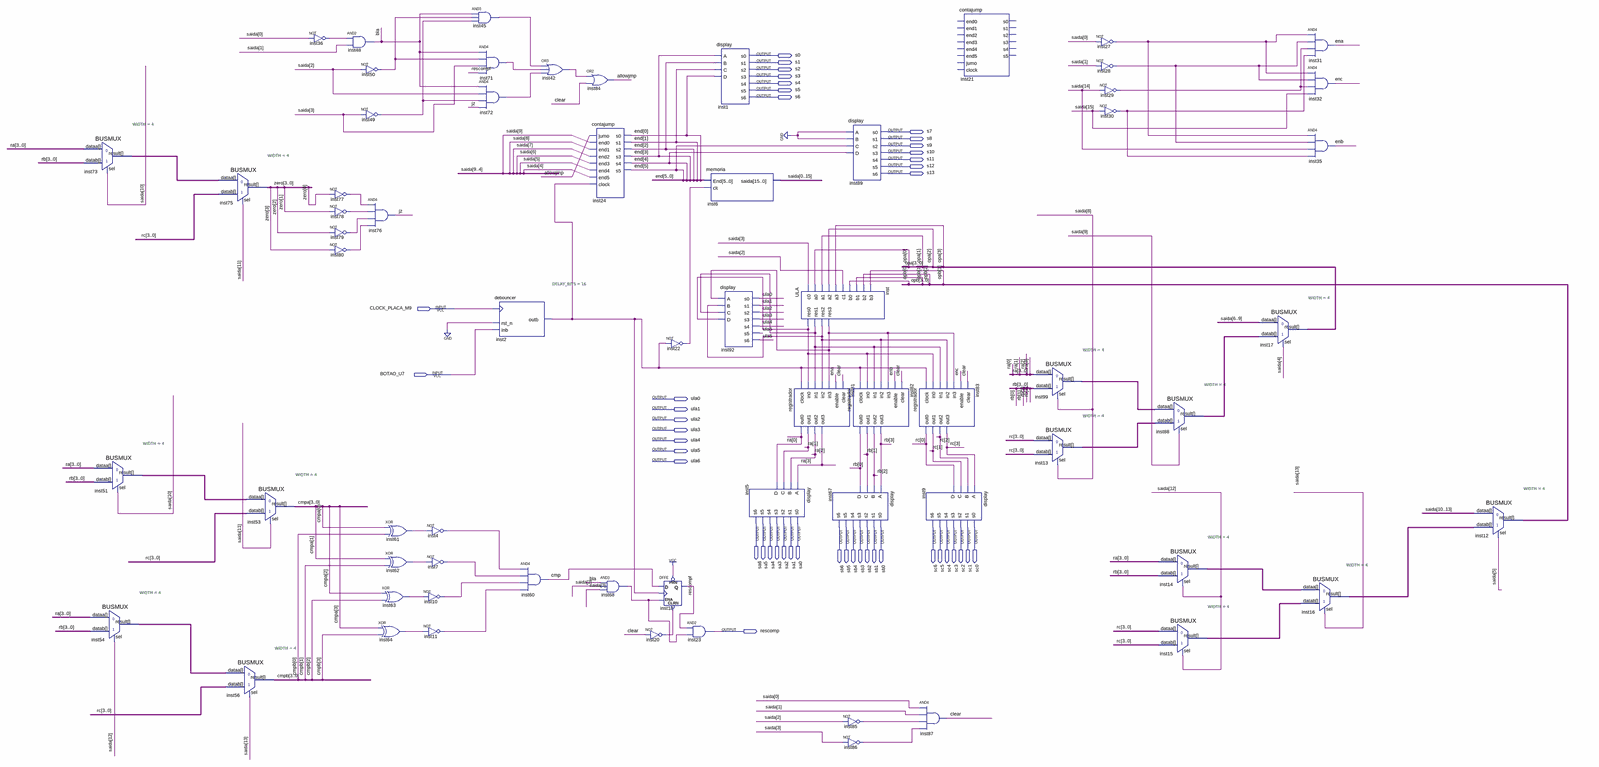
[diagram p0: schematic sheet, whole]
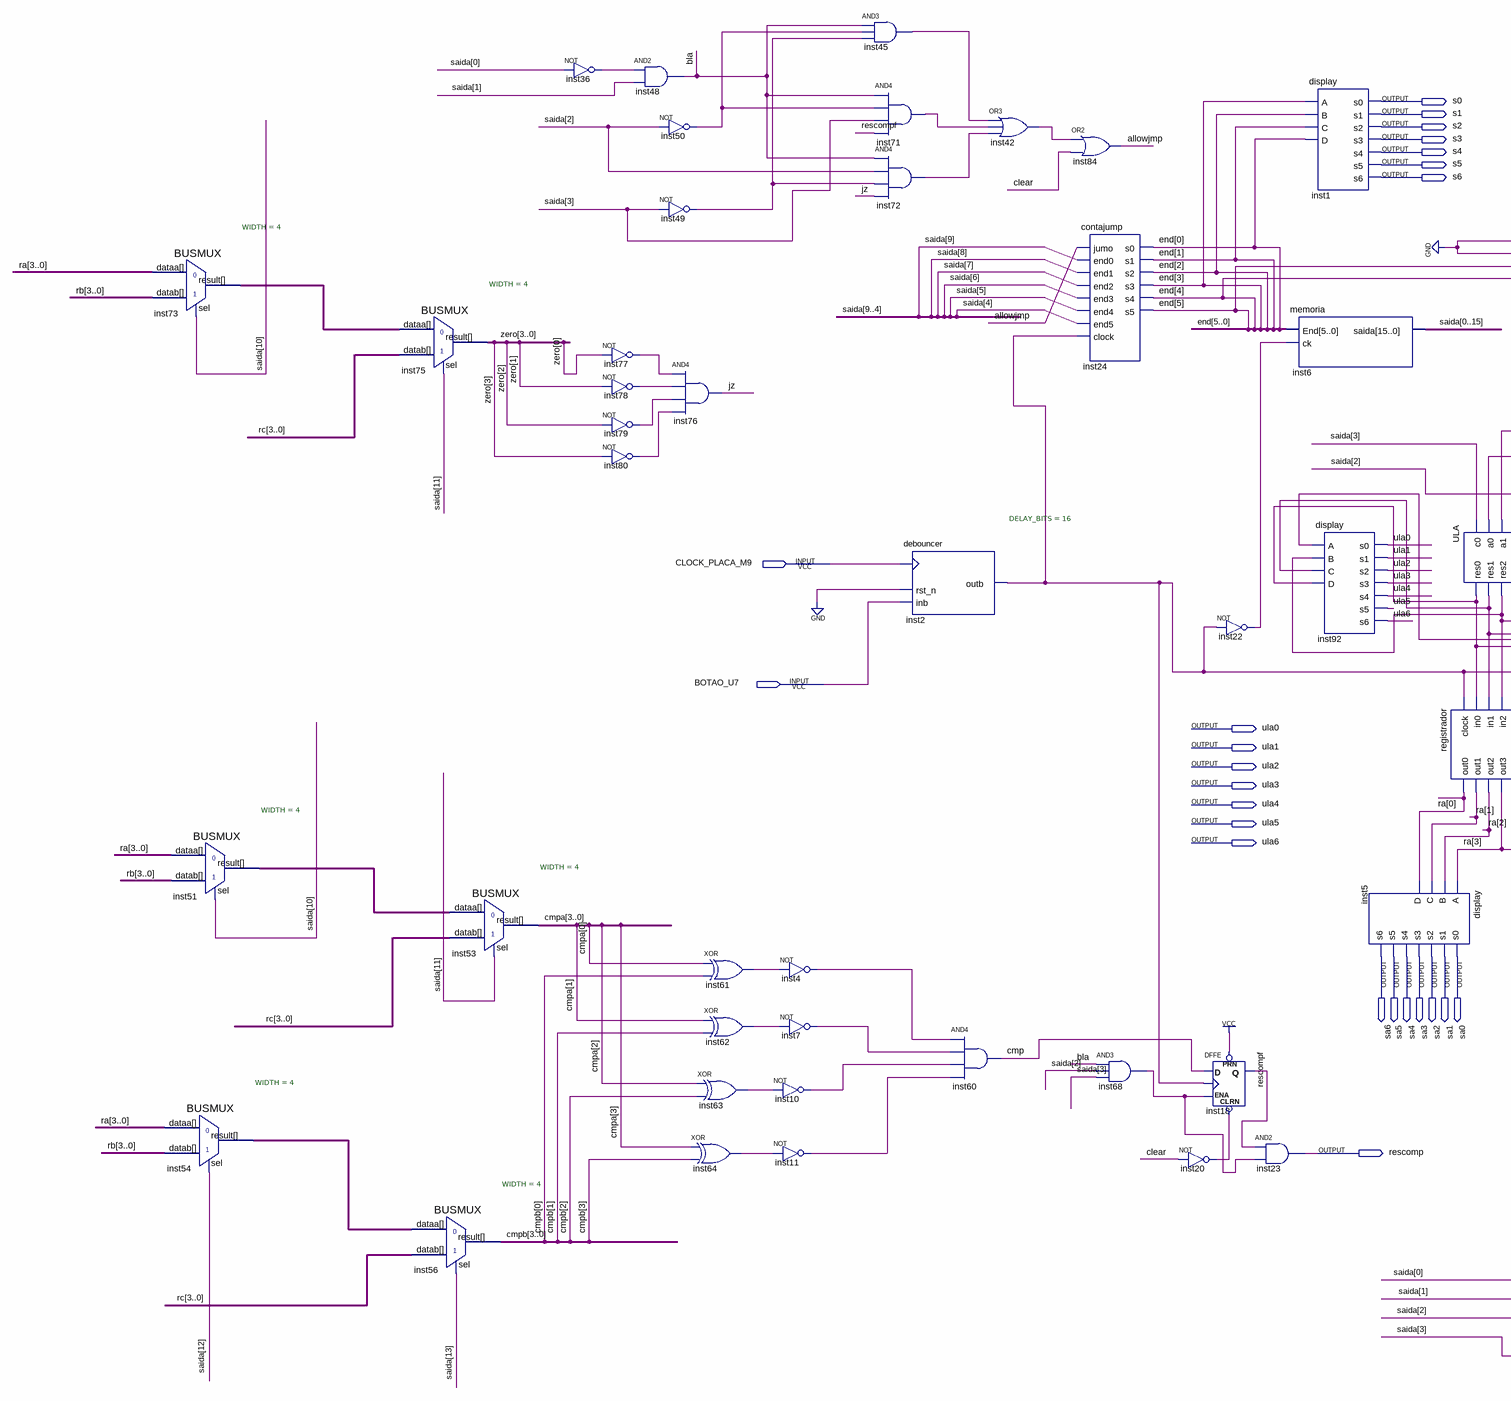
[diagram p1: schematic sheet, left part]
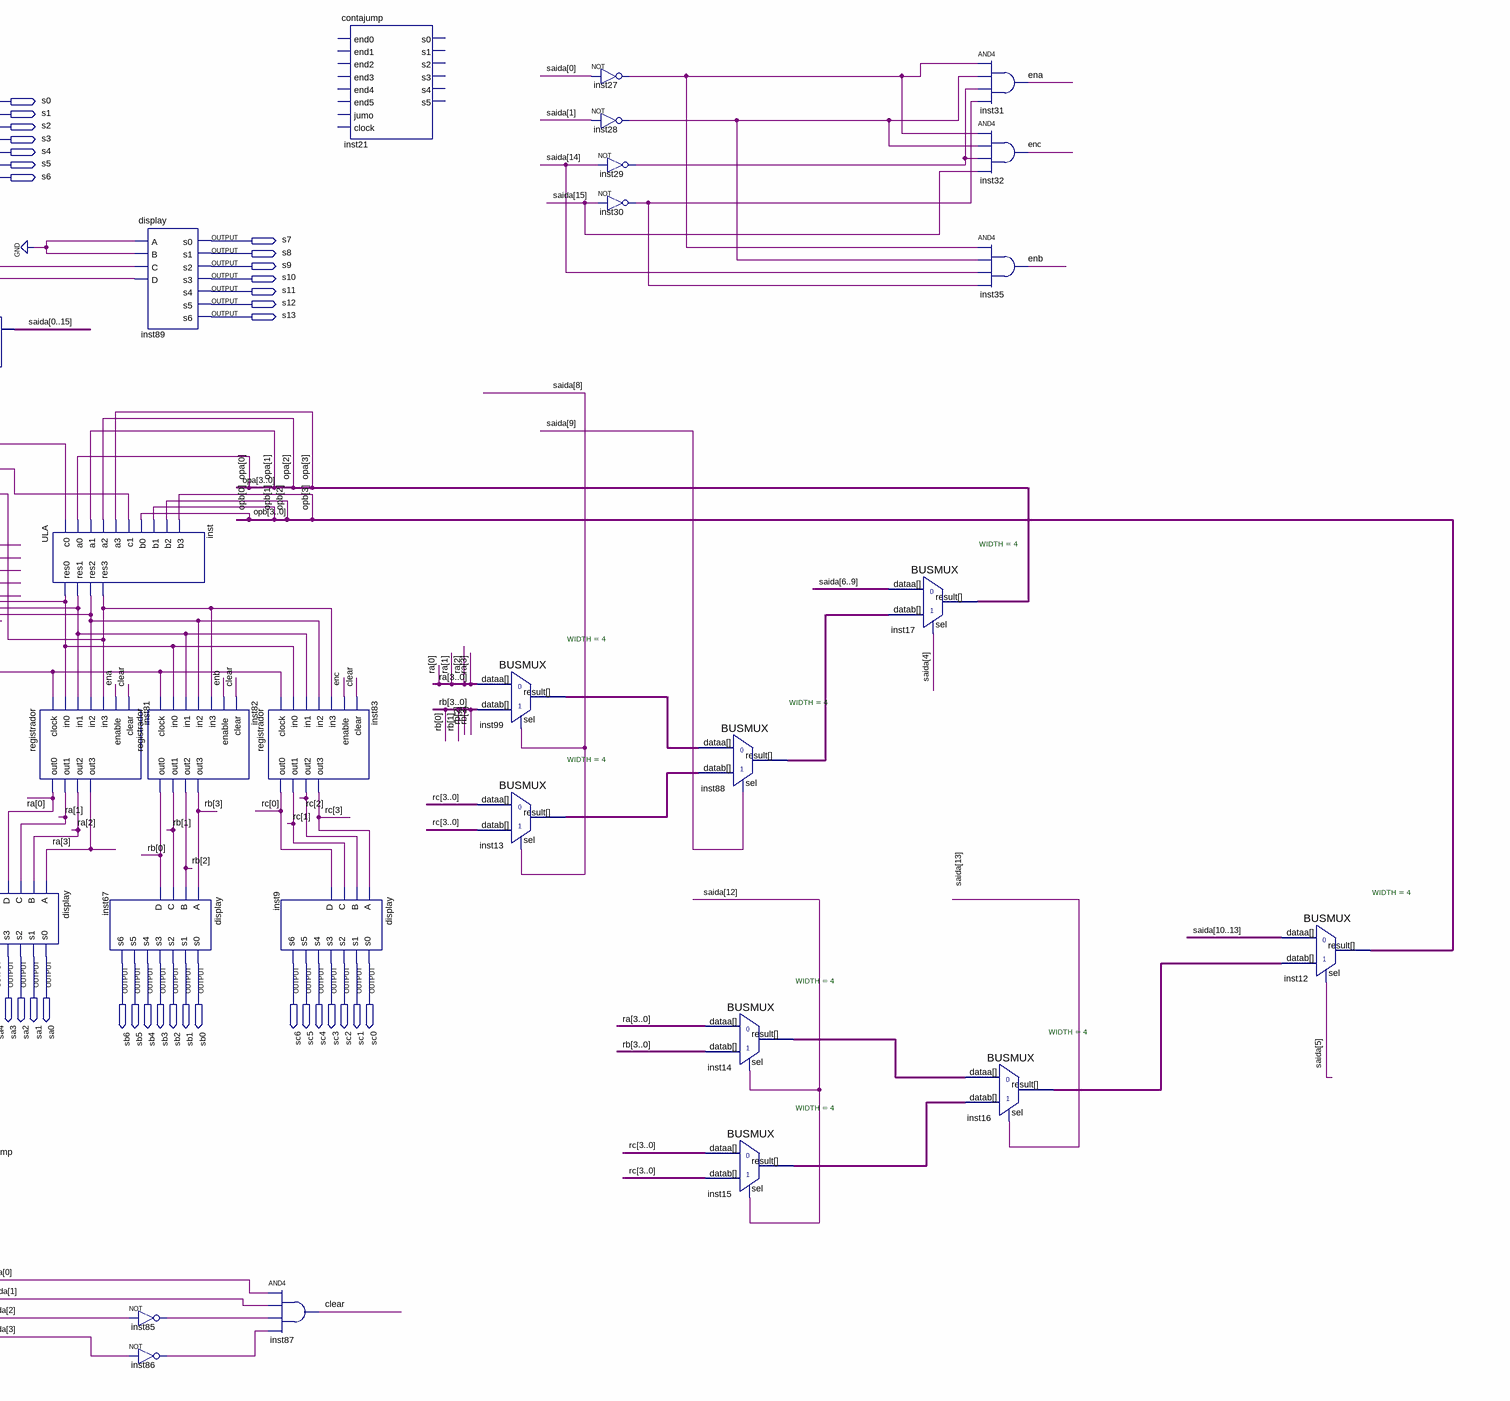
[diagram p2: schematic sheet, right part]
// Quartus schematic microCPU.bdf as structural Verilog: 66 symbols, 45 pins
module microCPU (
  input  CLOCK_PLACA_M9,
  input  BOTAO_U7,
  output s0,
  output s1,
  output s2,
  output s3,
  output s4,
  output s5,
  output s6,
  output s7,
  output s8,
  output s9,
  output s10,
  output s11,
  output s12,
  output s13,
  output ula0,
  output ula1,
  output ula2,
  output ula3,
  output ula4,
  output ula5,
  output ula6,
  output sa6,
  output sa5,
  output sa4,
  output sa3,
  output sa2,
  output sa1,
  output sa0,
  output sb6,
  output sb5,
  output sb4,
  output sb3,
  output sb2,
  output sb1,
  output sb0,
  output sc6,
  output sc5,
  output sc4,
  output sc3,
  output sc2,
  output sc1,
  output sc0,
  output rescomp
);

  wire allowjmp, bla, clear, cmp, ena, enb, enc, inst2_outb, inst4_out, inst7_out, inst10_out, inst11_out,
       inst20_out, inst22_out, inst27_out, inst28_out, inst29_out, inst30_out, inst36_out, inst42_out,
       inst45_out, inst49_out, inst50_out, inst61_out, inst62_out, inst63_out, inst64_out, inst68_out,
       inst71_out, inst72_out, inst77_out, inst78_out, inst79_out, inst80_out, inst85_out, inst86_out,
       inst_res0, inst_res1, inst_res2, inst_res3, jz, rescompf;
  wire [3:0] cmpa, cmpb, inst13_result, inst14_result, inst15_result, inst16_result, inst51_result,
       inst54_result, inst73_result, inst88_result, inst99_result, opa, opb, ra, rb, rc, zero;
  wire [5:0] \end ;
  wire [15:0] saida;

  BUSMUX #(.WIDTH(4)) inst73 (.datab(rb), .sel(saida[10]), .dataa(ra), .result(inst73_result));
  BUSMUX #(.WIDTH(4)) inst54 (.datab(rb), .sel(saida[12]), .dataa(ra), .result(inst54_result));
  BUSMUX #(.WIDTH(4)) inst51 (.datab(rb), .sel(saida[10]), .dataa(ra), .result(inst51_result));
  BUSMUX #(.WIDTH(4)) inst75 (.datab(rc), .sel(saida[11]), .dataa(inst73_result), .result(zero));
  BUSMUX #(.WIDTH(4)) inst56 (.datab(rc), .sel(saida[13]), .dataa(inst54_result), .result(cmpb));
  BUSMUX #(.WIDTH(4)) inst53 (.datab(rc), .sel(saida[11]), .dataa(inst51_result), .result(cmpa));
  not inst36 (inst36_out, saida[0]);
  not inst77 (inst77_out, zero[0]);
  not inst78 (inst78_out, zero[1]);
  not inst79 (inst79_out, zero[2]);
  not inst80 (inst80_out, zero[3]);
  and inst48 (bla, inst36_out, saida[1]);
  not inst50 (inst50_out, saida[2]);
  not inst49 (inst49_out, saida[3]);
  and inst76 (jz, inst77_out, inst78_out, inst79_out, inst80_out);
  xor inst61 (inst61_out, cmpa[0], cmpb[0]);
  xor inst62 (inst62_out, cmpa[1], cmpb[1]);
  xor inst63 (inst63_out, cmpa[2], cmpb[2]);
  xor inst64 (inst64_out, cmpa[3], cmpb[3]);
  not inst10 (inst10_out, inst63_out);
  not inst11 (inst11_out, inst64_out);
  not inst4 (inst4_out, inst61_out);
  not inst7 (inst7_out, inst62_out);
  and inst45 (inst45_out, bla, inst50_out, inst49_out);
  and inst71 (inst71_out, bla, inst50_out, saida[3], rescompf);
  and inst72 (inst72_out, bla, saida[2], inst49_out, jz);
  debouncer #(.DELAY_BITS(16)) inst2 (.rst_n(1'b0), .inb(BOTAO_U7), .clk(CLOCK_PLACA_M9), .outb(inst2_outb));
  and inst60 (cmp, inst4_out, inst7_out, inst10_out, inst11_out);
  or inst42 (inst42_out, inst45_out, inst71_out, inst72_out);
  or inst84 (allowjmp, inst42_out, clear);
  contajump inst24 (
    .jumo(allowjmp), .end0(saida[9]), .end1(saida[8]), .end2(saida[7]), .end3(saida[6]), .end4(saida[5]),
    .end5(saida[4]), .clock(inst2_outb), .s0(\end [0]), .s1(\end [1]), .s2(\end [2]), .s3(\end [3]),
    .s4(\end [4]), .s5(\end [5]));
  and inst68 (inst68_out, bla, saida[2], saida[3]);
  not inst20 (inst20_out, clear);
  not inst22 (inst22_out, inst2_outb);
  DFFE inst18 (.PRN(1'b1), .CLRN(inst20_out), .D(cmp), .CLK(inst2_outb), .ENA(inst68_out), .Q(rescompf));
  and inst23 (rescomp, rescompf, inst68_out);
  display inst1 (
    .A(\end [3]), .B(\end [2]), .C(\end [1]), .D(\end [0]), .s0(s0), .s1(s1), .s2(s2), .s3(s3), .s4(s4),
    .s5(s5), .s6(s6));
  memoria inst6 (
    .End(\end ), .ck(inst22_out),
    .saida({saida[0], saida[1], saida[2], saida[3], saida[4], saida[5], saida[6], saida[7], saida[8], saida[9], saida[10], saida[11], saida[12], saida[13], saida[14], saida[15]}));
  display inst92 (
    .A(inst_res3), .B(inst_res2), .C(inst_res1), .D(inst_res0), .s0(ula0), .s1(ula1), .s2(ula2), .s3(ula3),
    .s4(ula4), .s5(ula5), .s6(ula6));
  display inst5 (
    .A(ra[3]), .B(ra[2]), .C(ra[1]), .D(ra[0]), .s0(sa0), .s1(sa1), .s2(sa2), .s3(sa3), .s4(sa4), .s5(sa5),
    .s6(sa6));
  ULA inst (
    .c0(saida[3]), .a0(opa[0]), .a1(opa[1]), .a2(opa[2]), .a3(opa[3]), .c1(saida[2]), .b0(opb[0]),
    .b1(opb[1]), .b2(opb[2]), .b3(opb[3]), .res0(inst_res0), .res1(inst_res1), .res2(inst_res2),
    .res3(inst_res3));
  registrador inst81 (
    .clock(inst2_outb), .in0(inst_res0), .in1(inst_res1), .in2(inst_res2), .in3(inst_res3), .enable(ena),
    .clear(clear), .out0(ra[0]), .out1(ra[1]), .out2(ra[2]), .out3(ra[3]));
  display inst67 (
    .A(rb[3]), .B(rb[2]), .C(rb[1]), .D(rb[0]), .s0(sb0), .s1(sb1), .s2(sb2), .s3(sb3), .s4(sb4), .s5(sb5),
    .s6(sb6));
  display inst89 (
    .A(1'b0), .B(1'b0), .C(\end [5]), .D(\end [4]), .s0(s7), .s1(s8), .s2(s9), .s3(s10), .s4(s11), .s5(s12),
    .s6(s13));
  registrador inst82 (
    .clock(inst2_outb), .in0(inst_res0), .in1(inst_res1), .in2(inst_res2), .in3(inst_res3), .enable(enb),
    .clear(clear), .out0(rb[0]), .out1(rb[1]), .out2(rb[2]), .out3(rb[3]));
  not inst85 (inst85_out, saida[2]);
  not inst86 (inst86_out, saida[3]);
  registrador inst83 (
    .clock(inst2_outb), .in0(inst_res0), .in1(inst_res1), .in2(inst_res2), .in3(inst_res3), .enable(enc),
    .clear(clear), .out0(rc[0]), .out1(rc[1]), .out2(rc[2]), .out3(rc[3]));
  display inst9 (
    .A(rc[3]), .B(rc[2]), .C(rc[1]), .D(rc[0]), .s0(sc0), .s1(sc1), .s2(sc2), .s3(sc3), .s4(sc4), .s5(sc5),
    .s6(sc6));
  and inst87 (clear, saida[0], saida[1], inst85_out, inst86_out);
  contajump inst21 ();  // open: end0, end1, end2, end3, end4, end5, jumo, clock, s0, s1, s2, s3, s4, s5
  BUSMUX #(.WIDTH(4)) inst99 (.datab(rb), .sel(saida[8]), .dataa(ra), .result(inst99_result));
  BUSMUX #(.WIDTH(4)) inst13 (.datab(rc), .sel(saida[8]), .dataa(rc), .result(inst13_result));
  not inst27 (inst27_out, saida[0]);
  not inst28 (inst28_out, saida[1]);
  not inst29 (inst29_out, saida[14]);
  not inst30 (inst30_out, saida[15]);
  BUSMUX #(.WIDTH(4)) inst88 (.datab(inst13_result), .sel(saida[9]), .dataa(inst99_result), .result(inst88_result));
  BUSMUX #(.WIDTH(4)) inst14 (.datab(rb), .sel(saida[12]), .dataa(ra), .result(inst14_result));
  BUSMUX #(.WIDTH(4)) inst15 (.datab(rc), .sel(saida[12]), .dataa(rc), .result(inst15_result));
  BUSMUX #(.WIDTH(4)) inst17 (
    .datab(inst88_result), .sel(saida[4]), .dataa({saida[6], saida[7], saida[8], saida[9]}), .result(opa));
  and inst31 (ena, inst27_out, inst28_out, inst29_out, inst30_out);
  and inst32 (enc, inst27_out, inst28_out, inst29_out, saida[15]);
  and inst35 (enb, inst27_out, inst28_out, saida[14], inst30_out);
  BUSMUX #(.WIDTH(4)) inst16 (.datab(inst15_result), .sel(saida[13]), .dataa(inst14_result), .result(inst16_result));
  BUSMUX #(.WIDTH(4)) inst12 (
    .datab(inst16_result), .sel(saida[5]), .dataa({saida[10], saida[11], saida[12], saida[13]}), .result(opb));
endmodule
